# EAGLE design tranc_2c (EAGLE 6.5.0)
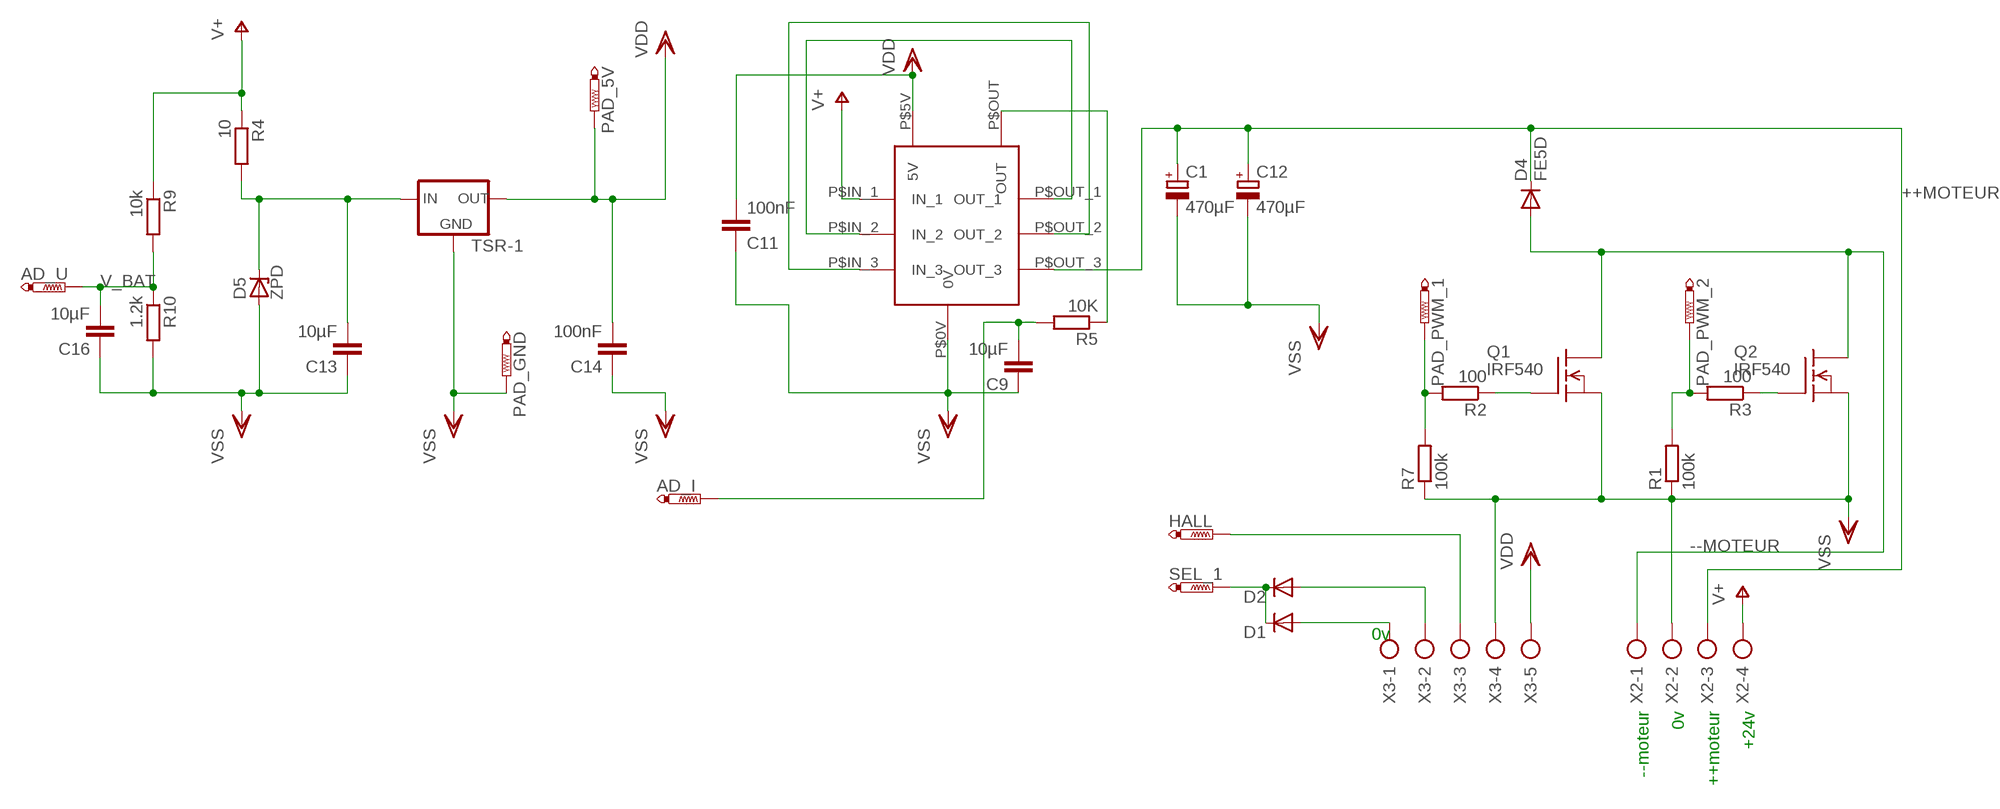
[diagram p0: schematic, sheet 1]

## Parts
AD_I  PTR1TP20SQ  [TP20SQ]
AD_U  PTR1TP20SQ  [TP20SQ]
C1  470µF  CPOL-EUTT5D11L  [TT5D11L]
C9  10µF  C-EUC1812  [C1812]
C11  100nF  C-EUC0805K  [C0805K]
C12  470µF  CPOL-EUTT5D11L  [TT5D11L]
C13  10µF  C-EUC1206K  [C1206K]
C14  100nF  C-EUC0805K  [C0805K]
C16  10µF  C-EUC0805K  [C0805K]
D1  DIODE-MINIMELF  [MINIMELF]
D2  DIODE-MINIMELF  [MINIMELF]
D4  FE5D  [G4-12]
D5  ZPD  [DO35Z10]
HALL  PTR1TP20SQ  [TP20SQ]
PAD_5V  PTR1TP20SQ  [TP20SQ]
PAD_GND  PTR1TP20SQ  [TP20SQ]
PAD_PWM_1  PTR1TP20SQ  [TP20SQ]
PAD_PWM_2  PTR1TP20SQ  [TP20SQ]
Q1  IRF540  [TO220]
Q2  IRF540  [TO220]
R1  100k  R-EU_M0805  [M0805]
R2  100  R-EU_M0805  [M0805]
R3  100  R-EU_M0805  [M0805]
R4  10  R-EU_M1206  [M1206]
R5  10K  R-EU_M0805  [M0805]
R7  100k  R-EU_M0805  [M0805]
R9  10k  R-EU_M0805  [M0805]
R10  1.2k  R-EU_M0805  [M0805]
SEL_1  PTR1TP20SQ  [TP20SQ]
TSR-1  78XXS  [78XXS]
U$1  LTS25-NP  [LTS25]
X2  AK300/4  [AK300/4]
X3  AK300/5  [AK300/5]

## Nets
++MOTEUR: C1.+ C12.+ D4.C U$1.P$OUT_3(OUT_3) X2.3
--MOTEUR: D4.A Q1.2(D) Q2.2(D) X2.1
N$1: Q1.1(G) R2.1
N$2: U$1.P$IN_2(IN_2) U$1.P$OUT_1(OUT_1)
N$3: HALL.TP X3.3
N$4: D2.A X3.2
N$5: U$1.P$IN_3(IN_3) U$1.P$OUT_2(OUT_2)
N$6: D1.C D2.C SEL_1.TP
N$7: PAD_PWM_1.TP R2.2 R7.2
N$8: R5.1 U$1.P$OUT(OUT)
N$10: Q2.1(G) R3.1
N$11: PAD_PWM_2.TP R1.2 R3.2
N$12: D1.A X3.1
N$13: C13.2 D5.C R4.2 TSR-1.IN
N$30: AD_I.TP C9.2 R5.2
V+: R4.1 R9.1 U$1.P$IN_1(IN_1) X2.4
V_BAT: AD_U.TP C16.2 R9.2 R10.1
VDD: C11.2 C14.2 PAD_5V.TP TSR-1.OUT U$1.P$5V(5V) X3.5
VSS: C1.- C9.1 C11.1 C12.- C13.1 C14.1 C16.1 D5.A PAD_GND.TP Q1.3(S) Q2.3(S) R1.1 R7.1 R10.2 TSR-1.GND U$1.P$0V(0V) X2.2 X3.4

## Notes on the sheet
- 0v
- --moteur | 0v | ++moteur | +24v

## Library data of the parts
AD_I AD_U HALL PAD_5V PAD_GND PAD_PWM_1 PAD_PWM_2 SEL_1 = testpad:PTR1: TEST PIN
C1 C12 = rcl:CPOL-EU: POLARIZED CAPACITOR, European symbol
C9 C11 C13 C14 C16 = rcl:C-EU: CAPACITOR, European symbol
D1 D2 = diode:DIODE-: DIODE
D4 = diode:FE5D: DIODE
D5 = diode:ZPD: Z DIODE 500 mW
Q1 Q2 = transistor-fet:IRF540: N-Channel Enhancement MOSFET (HEXFET); 100V; 28A; 0,077Ohm
R1-R5 R7 R9 R10 = rcl:R-EU_: RESISTOR, European symbol
TSR-1 = v-reg:78XXS: VOLTAGE REGULATOR
U$1 = lem:LTS25-NP
X2 = con-ptr500:AK300/4: CONNECTOR; OC_FARNELL: unknown; OC_NEWARK: unknown
X3 = con-ptr500:AK300/5: CONNECTOR; OC_FARNELL: unknown; OC_NEWARK: unknown

## Board
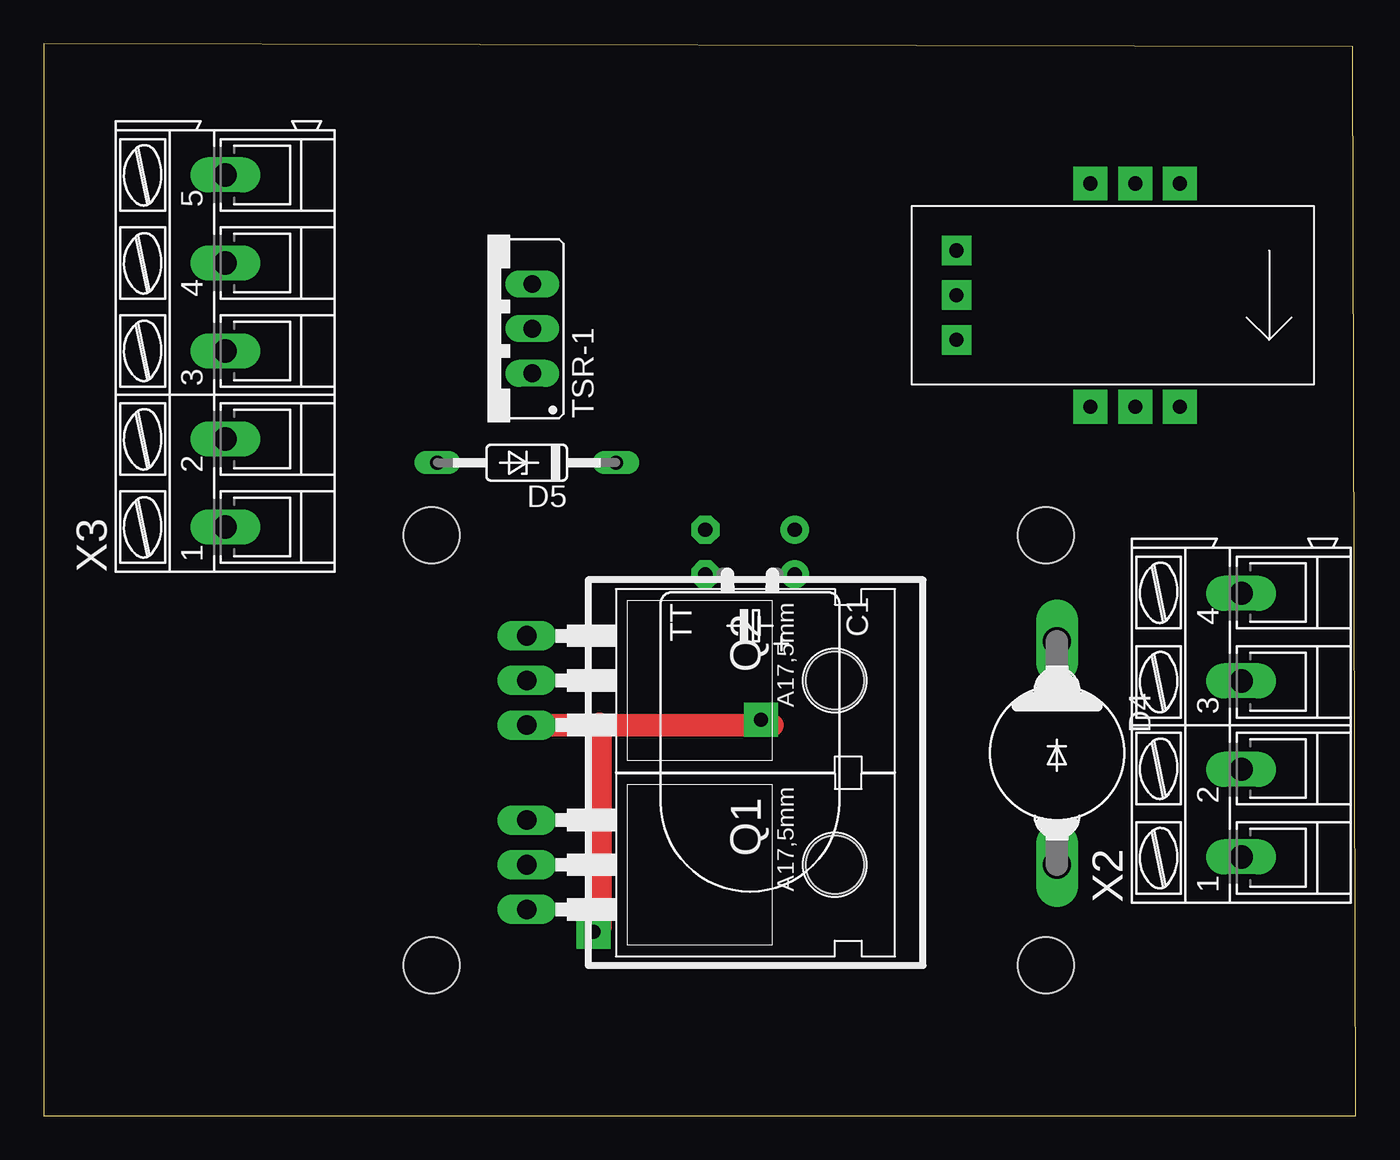
[diagram p1: board, top side]
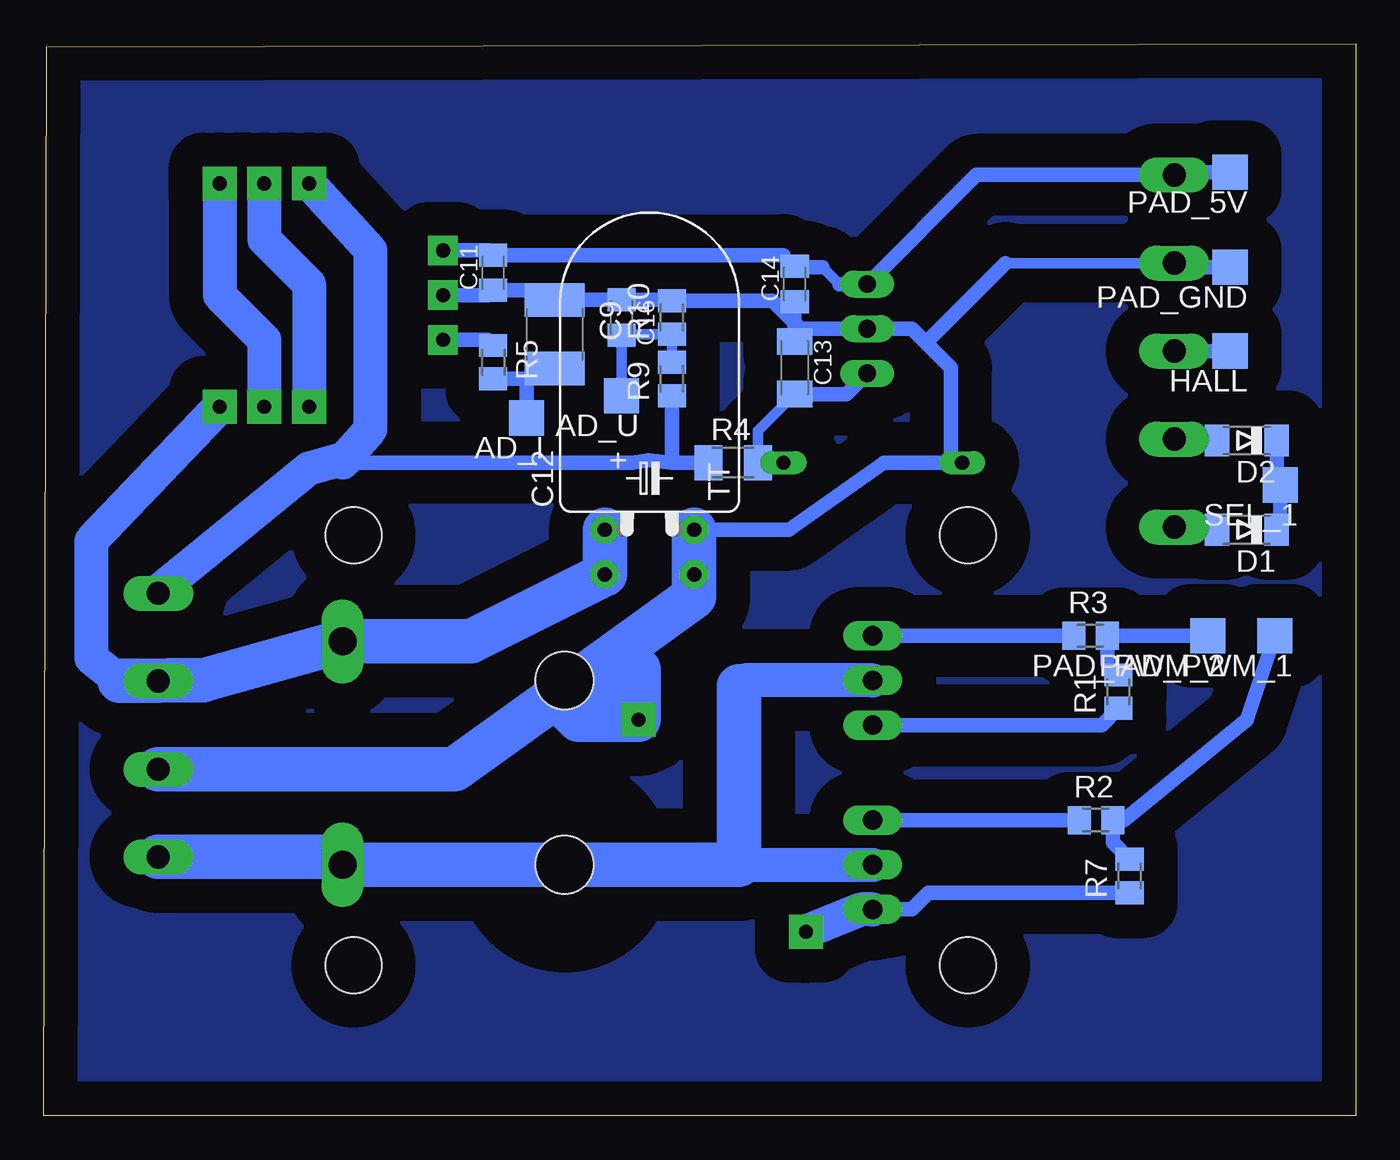
[diagram p2: board, bottom side, seen from below]

Size 74.6 x 60.95 mm. Coordinates in mm from the lower left corner, seen from the top.
Outline: 0,0 74.6,0 74.45,60.79 0,60.95 0,0
Copper layers (1*16): Top 0.035mm / dielectric 1.5mm / Bottom 0.035mm
Design rules "default": minimum track width 10mil, minimum drill 24mil, track to track 8mil, track to pad 8mil, pad to pad 8mil, via to via 8mil, smd to smd 8mil, copper to edge 40mil, drill to drill 8mil, minimum pad ring 10mil, minimum via ring 8mil, stop-mask expansion 4mil, vias tented up to drill 0mil, thermal gap 10mil
Holes 3.2 mm at 56.98,8.57 22.06,8.57 22.06,33.02 56.98,33.02

### Footprints (pad centres in the part's own frame; a part is rotated, then mirrored left to right if it is on the bottom)
TP20SQ = smd 2 x 2: TP 0,0
TT5D11L = drill 0.813 pad 1.6: + -2.54,0 | drill 0.813 pad 1.6 octagon: - 2.54,0
C1812 = smd 1.9 x 3.4: 1 -1.95,0; 2 1.95,0
C0805K = smd 1.3 x 1.6: 1 -1,0; 2 1,0
C1206K = smd 1.5 x 2: 1 -1.5,0; 2 1.5,0
MINIMELF = smd 1.4 x 1.8: A 1.7,0; C -1.7,0
G4-12 = drill 1.6 long: A 6.35,0; C -6.35,0
DO35Z10 = drill 0.813 long: A 5.08,0; C -5.08,0
TO220 = drill 1.118 long: 1 -2.54,-6.35; 2 0,-6.35; 3 2.54,-6.35 | hole 3.302: 0,11.176
M0805 = smd 1.3 x 1.6: 1 -0.95,0; 2 0.95,0
M1206 = smd 1.6 x 2: 1 -1.4,0; 2 1.4,0
78XXS = drill 1.016 long: GND 0,-2.54; IN -2.54,-2.54; OUT 2.54,-2.54
LTS25 = drill 0.8 pad 1.676 square: P$0V -10.16,0; P$5V -10.16,2.54; P$OUT -10.16,-2.54 | drill 0.8 pad 1.93 square: P$IN_1 -2.54,6.35; P$IN_2 0,6.35; P$IN_3 2.54,6.35; P$OUT_1 -2.54,-6.35; P$OUT_2 0,-6.35; P$OUT_3 2.54,-6.35
AK300/4 = drill 1.321 long: 1 -7.493,0; 2 -2.515,0; 3 2.515,0; 4 7.493,0
AK300/5 = drill 1.321 long: 1 -10.008,0; 2 -5.004,0; 3 0,0; 4 5.004,0; 5 10.008,0

### Placement (x,y rotation side)
AD_I  47.14,39.68 180 bottom
AD_U  41.74,40.95 180 bottom
C1  40.16,30.79 180 top
C9  45.55,44.45 270 bottom
C11  49.05,47.94 90 bottom
C12  40.16,33.33 0 bottom
C13  31.9,42.54 270 bottom
C14  31.9,47.3 90 bottom
C16  41.74,45.4 270 bottom
D1  6.18,33.33 180 bottom
D2  6.18,38.41 180 bottom
D4  57.62,20.63 270 top
D5  27.46,37.14 180 top
HALL  7.14,43.49 180 bottom
PAD_5V  7.14,53.65 180 bottom
PAD_GND  7.14,48.26 180 bottom
PAD_PWM_1  4.6,27.3 180 bottom
PAD_PWM_2  8.41,27.3 180 bottom
Q1  33.81,14.28 270 top
Q2  33.81,24.76 270 top
R1  13.49,24.12 90 bottom
R2  14.76,16.82 0 bottom
R3  15.08,27.3 0 bottom
R4  35.39,37.14 0 bottom
R5  49.05,42.86 270 bottom
R7  12.85,13.65 90 bottom
R9  38.89,41.91 90 bottom
R10  38.89,45.4 90 bottom
SEL_1  4.28,35.87 180 bottom
TSR-1  25.23,44.76 90 top
U$1  62.06,46.67 0 top
X2  68.1,22.22 90 top
X3  10.31,43.49 90 top

### Tracks (layer width: path | path; a pad name or v marks a point on that pad's centre or on a via)
++MOTEUR
  Bottom 1.27: U$1.P$OUT_3 64.92,40
  Bottom 1.93: 70.3,24.73 71.91,26.03 71.91,32.7 64.92,40
  Bottom 2.54: 70.3,24.73 X2.3 67.46,24.76 65.56,24.76 D4.C 50.32,26.98 C1.+ C12.+
--MOTEUR
  Bottom 1.27: 58.06,14.73 D4.A | 34.76,24.76 35.08,24.44
  Bottom 1.93: 35.08,14.28 Q1.2 | Q2.2 34.76,24.76
  Bottom 2.54: X2.1 58.06,14.73 | D4.A 35.08,14.28 35.08,24.44
N$1
  Bottom 0.813: Q1.1 R2.1
N$2
  Bottom 1.93: U$1.P$IN_2 62.06,49.84 59.52,47.3 U$1.P$OUT_1
N$3
  Bottom 0.813: HALL.TP X3.3
N$4
  Bottom 0.61: 10.24,38.41 X3.2
  Bottom 0.813: D2.A 10.24,38.41
N$5
  Bottom 1.93: U$1.P$IN_3 64.61,46.67 62.06,44.13 U$1.P$OUT_2
N$6
  Bottom 0.61: 4.48,36.08 SEL_1.TP | 4.28,33.54 D1.C
  Bottom 0.813: D2.C 4.48,36.08 | SEL_1.TP 4.28,33.54
N$7
  Bottom 0.813: PAD_PWM_1.TP 6.18,22.54 13.17,16.82 R2.2 13.81,15.55 R7.2
N$8
  Bottom 0.61: 49.37,44.13 R5.1
  Bottom 0.813: U$1.P$OUT 49.37,44.13
N$9
  pour Bottom (isolate 1.93): 0.15,60.64 74.13,60.64 74.13,0.31 0.15,0.31
N$10
  Bottom 0.813: Q2.1 R3.1
N$11
  Bottom 0.61: 14.12,25.71 R1.2 | R3.2
  Bottom 0.813: PAD_PWM_2.TP 12.53,27.3 R3.2 | R3.2 14.12,25.71
N$12
  Bottom 0.61: 10.16,33.33 X3.1
  Bottom 0.813: D1.A 10.16,33.33
N$13
  Bottom 0.61: R4.2 33.99,38.95 C13.2
  Bottom 0.813: C13.2 28.96,41.04 TSR-1.IN | D5.C R4.2
N$30
  Bottom 0.61: C9.2 46.14,41.91 46.82,41.91 47.14,41.59
  Bottom 0.813: R5.2 46.82,41.91 | AD_I.TP 47.14,41.59
V+
  Bottom 0.61: 39.12,41.04 R9.1 | 38.89,37.14 39.75,37.14 40.21,37.29
  Bottom 0.813: R9.1 38.89,37.14 | 38.89,37.14 40.21,37.29 41.11,37.14 57.59,37.14 | R4.1 38.89,37.14
  Bottom 1.27: 57.3,37.46 57.21,37.71 | X2.4 68.1,29.84
  Bottom 1.93: 57.3,37.46 59.52,36.83 68.1,29.84 | U$1.P$IN_1 56.03,49.21 56.03,39.05 57.21,37.71 57.59,37.14
V_BAT
  Bottom 0.61: R9.2 R10.1 41.7,44.45 C16.2 AD_U.TP
VDD
  Bottom 0.61: 49.32,49.21 C11.2 | 29.36,47.3 30.31,48.26 | 31.86,48.26 C14.2 32.54,48.94 | 10.16,53.65 X3.5
  Bottom 0.813: U$1.P$5V 49.32,49.21 | 29.36,47.3 TSR-1.OUT 21.58,53.5 X3.5 | 30.31,48.26 31.86,48.26 | C11.2 32.54,48.94 | PAD_5V.TP 10.16,53.65
VSS  (via drill 0.8 pad 1.93)
  Top 1.27: Q2.3 31.58,22.22 41.43,22.22 v40.79,22.54
  Top 1.422: 31.58,22.22 31.58,10.79 v31.27,10.47
  Bottom 0.61: 49.32,46.67 C11.1 | 46.1,46.94 C9.1 | 31.58,44.76 31.9,44.76 | C16.1 | 39.25,46.4 R10.2 | 10.07,48.26 X3.4 19.91,48.5 | 23.01,37.78 D5.A
  Bottom 0.813: U$1.P$0V 49.32,46.67 | C11.1 46.1,46.94 | C13.1 31.9,44.76 C14.1 | C9.1 C16.1 | C16.1 39.25,46.4 | R10.2 33.17,46.35 31.58,44.76 TSR-1.GND 25.23,44.76 24.44,43.97 | 23.01,37.78 23.01,42.54 24.44,43.97 | PAD_GND.TP 10.07,48.26 | 19.91,48.5 24.44,43.97 | C12.- 32.22,33.33 26.82,37.14 D5.A | Q2.3 14.44,22.22 R1.1 | Q1.3 25.23,11.74 24.28,12.7 R7.1
  Bottom 1.93: Q1.3 28.09,11.74 v31.27,10.47
  Bottom 2.54: C12.- C1.- 37.62,29.52 45.49,23.85 | X2.2 51.24,19.7 45.49,23.85 | 45.49,23.85 44.19,22.54 v40.79,22.54 40.79,25.39 41.43,26.03 41.43,25.08 42.38,24.12

### Text on the board
Bottom: trancannage bottom